# Altium schematic sheet SIO - IT8613E.schdoc
size 420 x 298 mm; Symbol: Sheet-Symbol_A3; Company: 嘉立创EDA; Version: V1.0; Page Size: A3; @Project Name: 【全网首发】X86电脑主板_copy; @Page Count: 12; @Update Date: 2025-10-09; @Create Date: 2025-10-09; @Schematic Name: SCHEMATIC1_1; @Page No: 0; @Page Name: SIO - IT8613E; Device: Sheet-Symbol_A3
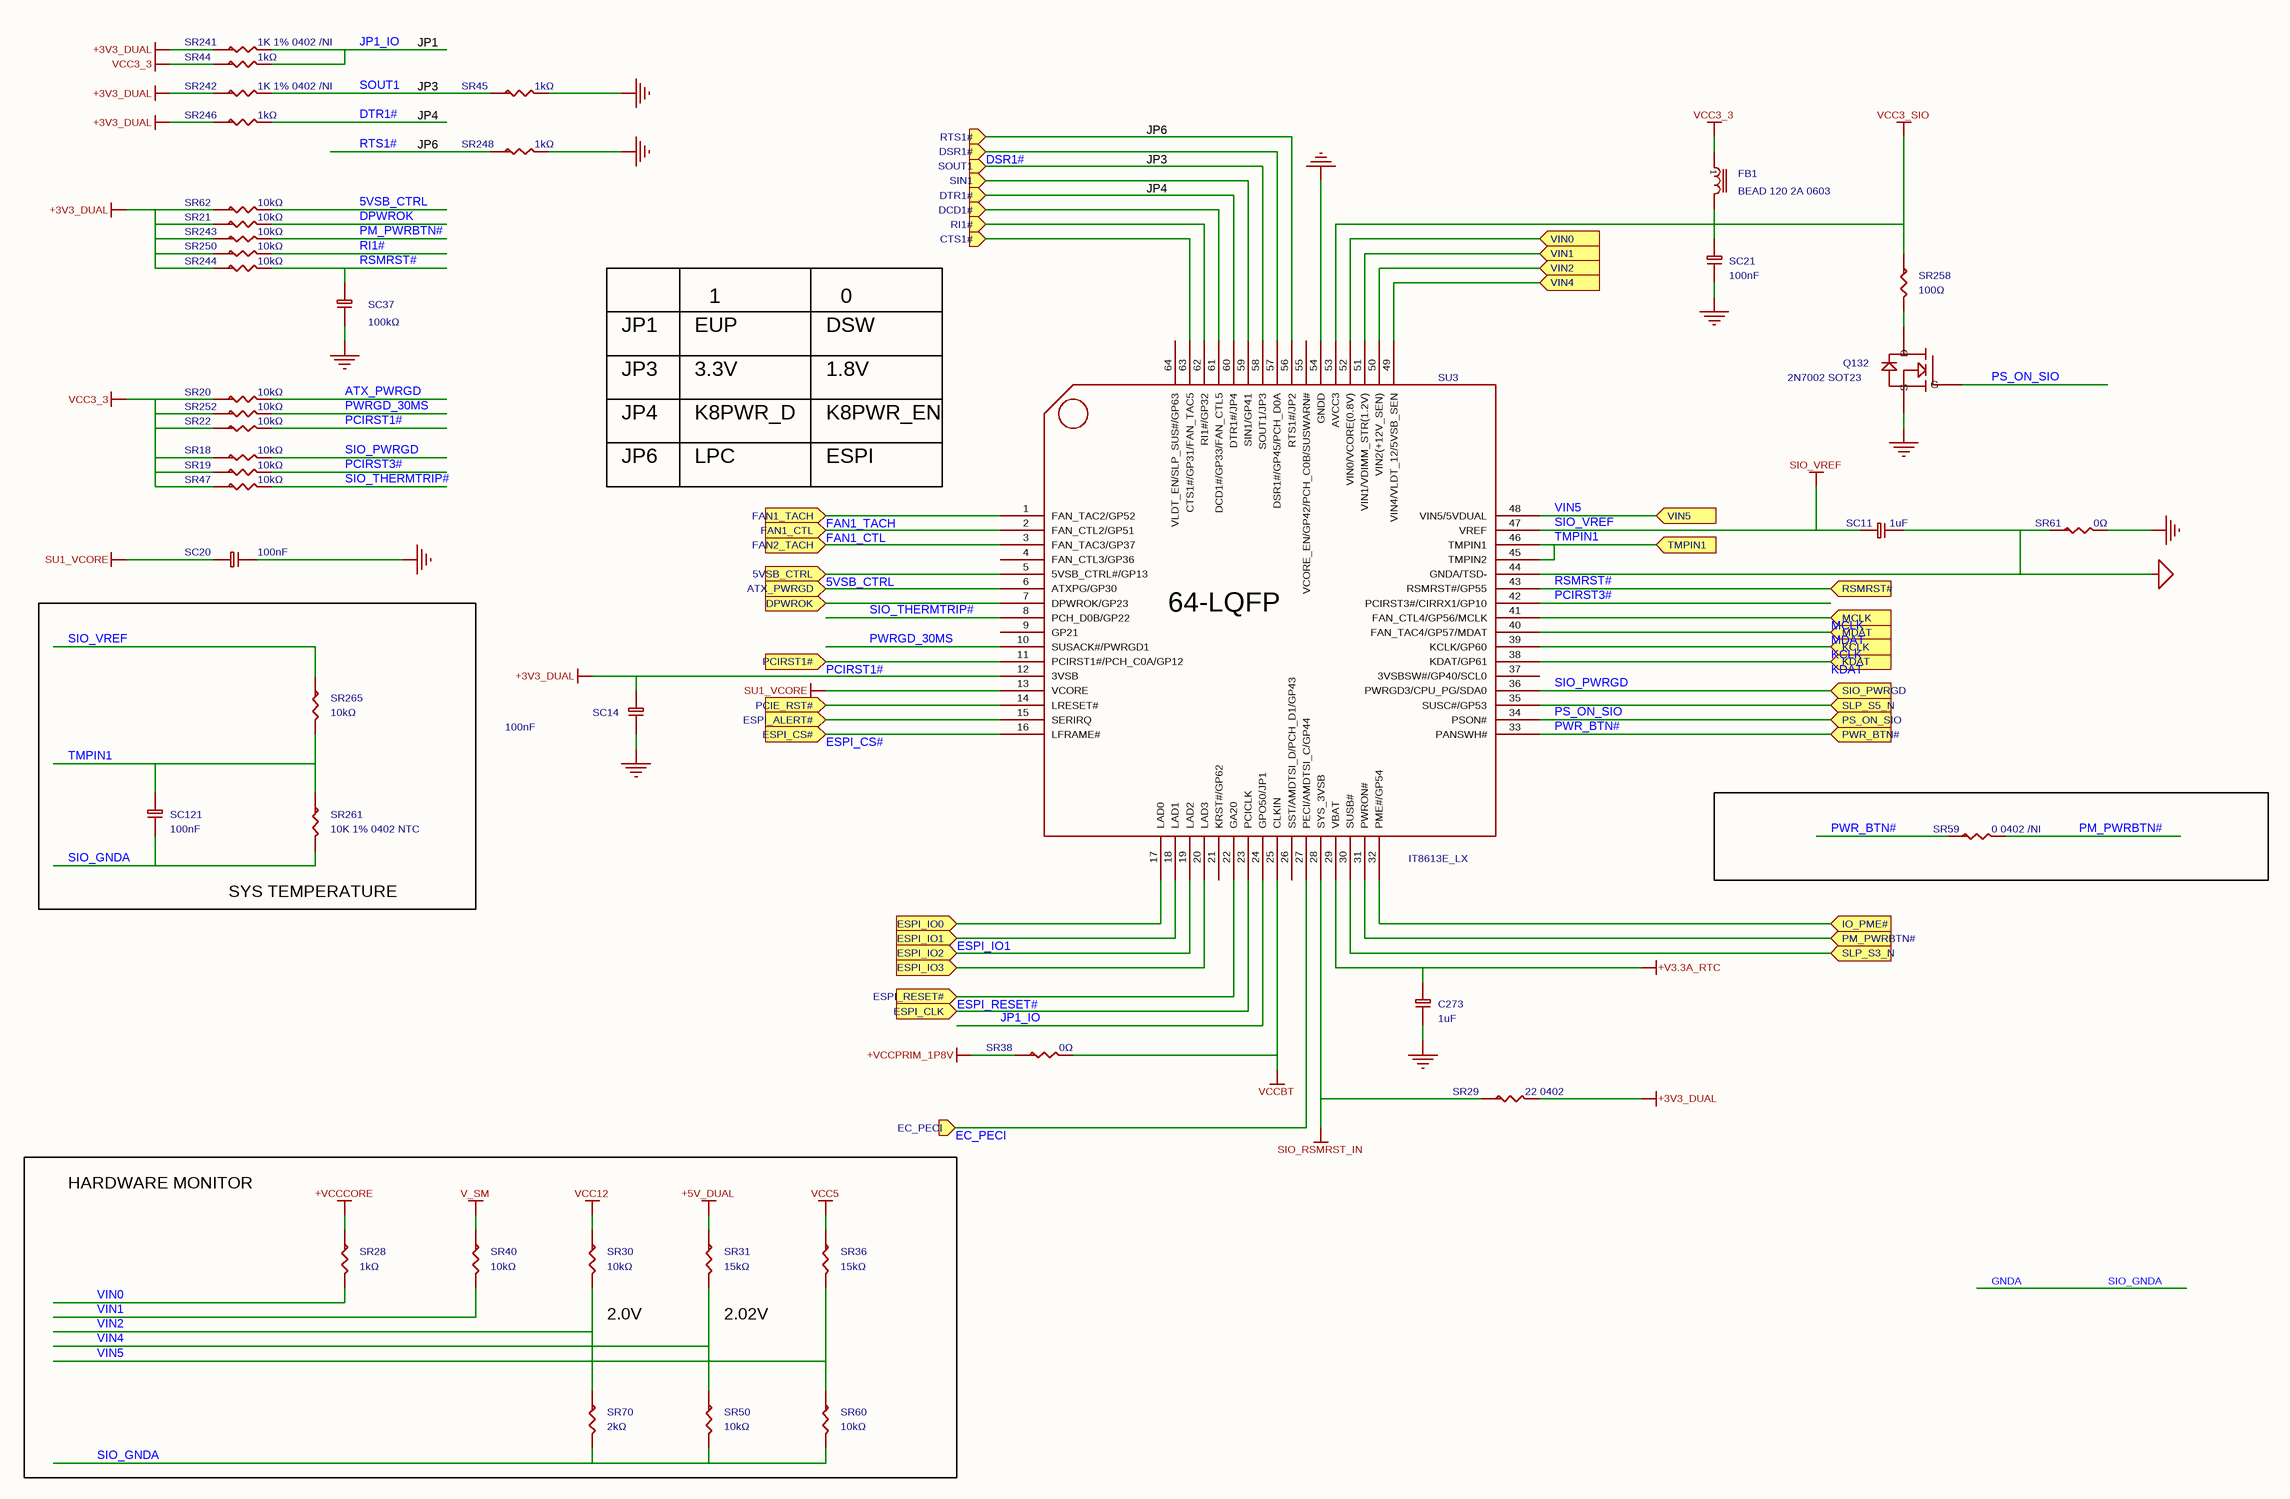
[diagram p0: SIO - IT8613E.schdoc]

## Parts
C273  1uF  [C0402]
FB1  value BEAD 120 2A 0603  [FB0603_1]  (hidden comment: FERRITE BEAD)
Q132  value 2N7002 SOT23  [SOT23_123]  (hidden comment: 2N7002)
SC11  1uF  [C0402]
SC14  100nF  [C0402_2]
SC20  100nF  [C0402_1]
SC21  100nF  [C0402]
SC37  100kΩ  [C0402]
SC121  100nF  [C0402]
SR18  10kΩ  [R0402_2]
SR19  10kΩ  [R0402_3]
SR20  10kΩ  [R0402]
SR21  10kΩ  [R0402]
SR22  10kΩ  [R0402]
SR28  1kΩ  [R0402_2]
SR29  value 22 0402  [R0402_3]  (hidden comment: R-0603)
SR30  10kΩ  [R0402_2]
SR31  15kΩ  [R0402_2]
SR36  15kΩ  [R0402_2]
SR38  0Ω  [R0402_1]
SR40  10kΩ  [R0402_2]
SR44  1kΩ  [R0402_3]
SR45  1kΩ  [R0402_2]
SR47  10kΩ  [R0402_1]
SR50  10kΩ  [R0402]
SR59  value 0 0402 /NI  [R0402]  (hidden comment: R-0603)
SR60  10kΩ  [R0402]
SR61  0Ω  [R0402]
SR62  10kΩ  [R0402]
SR70  2kΩ  [R0402_2]
SR241  value 1K 1% 0402 /NI  [R0402_3]  (hidden comment: R-0603)
SR242  value 1K 1% 0402 /NI  [R0402]  (hidden comment: R-0603)
SR243  10kΩ  [R0402_2]
SR244  10kΩ  [R0402_2]
SR246  1kΩ  [R0402_2]
SR248  1kΩ  [R0402]
SR250  10kΩ  [R0402_2]
SR252  10kΩ  [R0402_1]
SR258  100Ω  [R0402]
SR261  value 10K 1% 0402 NTC  [R0402]  (hidden comment: NCP15XH103F03RC)
SR265  10kΩ  [R0402]
SU3  value IT8613E_LX  [LQFP64_0_4]  (hidden comment: IT8712H_AP_0)

## Blocks framed on the sheet
SYS TEMPERATURE: SC121 SR261 SR265

## Ports
5VSB_CTRL (in), ATX_PWRGD (in), CTS1# (in), DCD1# (in), DPWROK (in), DSR1# (in), DTR1# (in), EC_PECI (in), ESPI_ALERT# (in), ESPI_CLK (in), ESPI_CS# (in), ESPI_IO0 (in), ESPI_IO1 (in), ESPI_IO2 (in), ESPI_IO3 (in), ESPI_RESET# (in), FAN1_CTL (in), FAN1_TACH (in), FAN2_TACH (in), IO_PME# (in), KCLK (in), KDAT (in), MCLK (in), MDAT (in), PCIE_RST# (in), PCIRST1# (in), PM_PWRBTN# (in), PS_ON_SIO (in), PWR_BTN# (in), RI1# (in), RSMRST# (in), RTS1# (in), SIN1 (in), SIO_PWRGD (in), SLP_S3_N (in), SLP_S5_N (in), SOUT1 (in), TMPIN1 (in), VIN0 (in), VIN1 (in), VIN2 (in), VIN4 (in), VIN5 (in)

## Nets
+3V3_DUAL: SC14.2 SR21.1 SR29.2 SR62.1 SR241.1 SR242.1 SR243.1 SR244.1 SR246.1 SR250.1 SU3.12(3VSB)
+5V_DUAL: SR31.1
+V3.3A_RTC: C273.2 SU3.29(VBAT)
+VCCCORE: SR28.1
+VCCPRIM_1P8V: SR38.1
GND: C273.1 Q132.2(S) SC14.1 SC20.1 SC21.1 SC37.1 SR45.2 SR61.2 SR248.2 SU3.54(GNDD)
GNDA: SC11.1 SC121.1 SR50.2 SR60.2 SR61.1 SR70.2 SR261.2 SU3.44(GNDA/TSD-)  [also labelled SIO_GNDA]
SIO_RSMRST_IN: SR29.1 SU3.28(SYS_3VSB)
SIO_VREF: SC11.2 SR265.1 SU3.47(VREF)
SU1_VCORE: SC20.2 SU3.13(VCORE)
V_SM: SR40.1
VCC3_3: FB1.1 SR18.1 SR19.1 SR20.1 SR22.1 SR44.1 SR47.1 SR252.1
VCC3_SIO: FB1.2 SC21.2 SR258.1 SU3.53(AVCC3)
VCC5: SR36.1
VCC12: SR30.1
VCCBT: SR38.2 SU3.25(CLKIN)
5VSB_CTRL: SR62.2 SU3.5(5VSB_CTRL#/GP13) ; port 5VSB_CTRL
ATX_PWRGD: SU3.6(ATXPG/GP30) ; port ATX_PWRGD
ATX_PWRGD: SR20.2  [a separate net that carries the same name]
CTS1#: SU3.63(CTS1#/GP31/FAN_TAC5) ; port CTS1#
DCD1#: SU3.61(DCD1#/GP33/FAN_CTL5) ; port DCD1#
DPWROK: SR21.2
DPWROK: SU3.7(DPWROK/GP23) ; port DPWROK  [a separate net that carries the same name]
DSR1#: SU3.57(DSR1#/GP45/PCH_D0A) ; port DSR1#
DTR1#: SR246.2
DTR1#: SU3.60(DTR1#/JP4) ; port DTR1#  [a separate net that carries the same name]
EC_PECI: SU3.27(PECI/AMDTSI_C/GP44) ; port EC_PECI
ESPI_ALERT#: SU3.15(SERIRQ) ; port ESPI_ALERT#
ESPI_CLK: SU3.23(PCICLK) ; port ESPI_CLK
ESPI_CS#: SU3.16(LFRAME#) ; port ESPI_CS#
ESPI_IO0: SU3.17(LAD0) ; port ESPI_IO0
ESPI_IO1: SU3.18(LAD1) ; port ESPI_IO1
ESPI_IO2: SU3.19(LAD2) ; port ESPI_IO2
ESPI_IO3: SU3.20(LAD3) ; port ESPI_IO3
ESPI_RESET#: SU3.22(GA20) ; port ESPI_RESET#
FAN1_CTL: SU3.2(FAN_CTL2/GP51) ; port FAN1_CTL
FAN1_TACH: SU3.1(FAN_TAC2/GP52) ; port FAN1_TACH
FAN2_TACH: SU3.3(FAN_TAC3/GP37) ; port FAN2_TACH
IO_PME#: SU3.32(PME#/GP54) ; port IO_PME#
JP1_IO: SR44.2 SR241.2 SU3.24(GPO50/JP1)
KCLK: SU3.39(KCLK/GP60) ; port KCLK
KDAT: SU3.38(KDAT/GP61) ; port KDAT
MCLK: SU3.41(FAN_CTL4/GP56/MCLK) ; port MCLK
MDAT: SU3.40(FAN_TAC4/GP57/MDAT) ; port MDAT
PCIE_RST#: SU3.14(LRESET#) ; port PCIE_RST#
PCIRST1#: SR22.2 SU3.11(PCIRST1#/PCH_C0A/GP12) ; port PCIRST1#
PCIRST3#: SR19.2 SU3.42(PCIRST3#/CIRRX1/GP10)
PM_PWRBTN#: SR59.2 SR243.2
PM_PWRBTN#: SU3.31(PWRON#) ; port PM_PWRBTN#  [a separate net that carries the same name]
PS_ON_SIO: Q132.1(G) SU3.34(PSON#) ; port PS_ON_SIO
PWR_BTN#: SR59.1 SU3.33(PANSWH#) ; port PWR_BTN#
PWRGD_30MS: SR252.2 SU3.10(SUSACK#/PWRGD1)
RI1#: SU3.62(RI1#/GP32) ; port RI1#
RI1#: SR250.2  [a separate net that carries the same name]
RSMRST#: SC37.2 SR244.2 SU3.43(RSMRST#/GP55) ; port RSMRST#
RTS1#: SU3.56(RTS1#/JP2) ; port RTS1#
RTS1#: SR248.1  [a separate net that carries the same name]
SIN1: SU3.59(SIN1/GP41) ; port SIN1
SIO_PWRGD: SR18.2 SU3.36(PWRGD3/CPU_PG/SDA0) ; port SIO_PWRGD
SIO_THERMTRIP#: SR47.2 SU3.8(PCH_D0B/GP22)
SLP_S3_N: SU3.30(SUSB#) ; port SLP_S3_N
SLP_S5_N: SU3.35(SUSC#/GP53) ; port SLP_S5_N
SOUT1: SU3.58(SOUT1/JP3) ; port SOUT1
SOUT1: SR45.1 SR242.2  [a separate net that carries the same name]
TMPIN1: SC121.2 SR261.1 SR265.2 SU3.45(TMPIN2) SU3.46(TMPIN1) ; port TMPIN1
VIN0: SU3.52(VIN0/VCORE(0.8V)) ; port VIN0
VIN0: SR28.2  [a separate net that carries the same name]
VIN1: SU3.51(VIN1/VDIMM_STR(1.2V)) ; port VIN1
VIN1: SR40.2  [a separate net that carries the same name]
VIN2: SU3.50(VIN2(+12V_SEN)) ; port VIN2
VIN2: SR30.2 SR70.1  [a separate net that carries the same name]
VIN4: SU3.49(VIN4/VLDT_12/5VSB_SEN) ; port VIN4
VIN4: SR31.2 SR50.1  [a separate net that carries the same name]
VIN5: SR36.2 SR60.1 SU3.48(VIN5/5VDUAL) ; port VIN5
NetQ132_3: Q132.3(D) SR258.2

Not connected (* = marked no-connect by the designer): SU3 4(FAN_CTL3/GP36) 9(GP21) 21(KRST#/GP62) 26(SST/AMDTSI_D/PCH_D1/GP43) 37(3VSBSW#/GP40/SCL0) 55(VCORE_EN/GP42/PCH_C0B/SUSWARN#) 64(VLDT_EN/SLP_SUS#/GP63)

## Notes on the sheet
- JP1
- JP3
- JP4
- JP6
- EUP
- 1
- DSW
- 0
- 3.3V
- K8PWR_D
- 1.8V
- K8PWR_EN
- LPC
- ESPI
- HARDWARE MONITOR
- (near SR30) 2.0V
- (near SR31) 2.02V
- 更新日期
- 2025-10-09
- 原理图
- 图页
- SCHEMATIC1_1
- SIO - IT8613E
- 创建日期
- 物料编码
- 审阅
- 绘制
- 【全网首发】X86电脑主板_copy
- 版本
- V1.0
- 尺寸
- A3
- 页
- 嘉立创EDA
- 共
- 12
- (in symbol IT8712H_AP_0) 64-LQFP

## Library data of the parts
C273 SC11 = CL05A105KQ5NNNC: 容值:1uF;精度:±10%;额定电压:6.3V;材质(温度系数):X5R;; Manufacturer: SAMSUNG(三星); Symbol: C-0603_2; AddInBom: yes; ModelId: 36a51122f27c49738f86b3bfa98863e0; ModelName: C0402_L1.0-W0.5-H0.5; ModelTransform: 39.37,19.685,0,0,0,0,0,0,0; Tolerance: ±10%; Voltage Rated: 6.3V; Temperature Coefficient: X5R; Device: CL05A105KQ5NNNC; Value: 1uF; LCSC Part Name: 1uF ±10% 6.3V; SupplierPart: C107372; ManufacturerPart: CL05A105KQ5NNNC; Supplier Footprint: 0402; JLCPCB Part Class: Extended Part; Datasheet: https://atta.szlcsc.com/upload/public/pdf/source/20160218/1457707763339.pdf; Supplier: LCSC; ConvertToPcb: yes; FootprintName: C0402
FB1 = FERRITE BEAD_2: Check: false; AddInBom: yes; Device: FERRITE BEAD_2; Symbol: FERRITE BEAD; FootprintName: FB0603_1; ConvertToPcb: yes
Q132 = 2N7002_C8545: 类型:N沟道;漏源电压(Vdss):60V;连续漏极电流(Id):115mA;功率(Pd):200mW;导通电阻(RDS(on)@Vgs,Id):7.5Ω@10V,500mA;阈值电压(Vgs(th)@Id):2.5V@250uA;; Manufacturer: CJ(江苏长电/长晶); Symbol: MOS,2N7002,SOT23,60V,300mA_0; Type: N沟道; ModelId: c62791f0466c4ae2a892c056b845b0ca; AddInBom: yes; ModelName: SOT-23-3P_L2.9-W1.3-H1.0-LS2.4-P0.95; ModelTransform: 98.425,114.173,0,180,0,0,0.0005,-0.0005,0; Power Dissipation (Pd): 200mW; Drain Source Voltage (Vdss): 60V; Continuous Drain Current (Id): 115mA; Device: 2N7002_C8545; Supplier: LCSC; Datasheet: https://atta.szlcsc.com/upload/public/pdf/source/20170302/1488422688078.pdf; FootprintName: SOT23_123; SupplierPart: C8545; ConvertToPcb: yes; LCSC Part Name: N沟道 60V 115mA; JLCPCB Part Class: Basic Part; ManufacturerPart: 2N7002; Supplier Footprint: SOT-23; Gate Threshold Voltage (Vgs(th)@Id): 2.5V@250uA; Drain Source On Resistance (RDS(on)@Vgs,Id): 7.5Ω@10V,500mA
SC14 SC20 SC21 SC121 = CL05B104KO5NNNC: 容值:100nF;精度:±10%;额定电压:16V;材质(温度系数):X7R;; Manufacturer: SAMSUNG(三星); Symbol: C-0603_2; ModelId: 36a51122f27c49738f86b3bfa98863e0; Tolerance: ±10%; AddInBom: yes; Voltage Rated: 16V; ModelName: C0402_L1.0-W0.5-H0.5; ModelTransform: 39.37,19.685,0,0,0,0,0,0,0; Temperature Coefficient: X7R; Device: CL05B104KO5NNNC; Value: 100nF; Supplier: LCSC; Datasheet: https://atta.szlcsc.com/upload/public/pdf/source/20160103/1457707674891.pdf; SupplierPart: C1525; ConvertToPcb: yes; LCSC Part Name: 100nF ±10% 16V; JLCPCB Part Class: Basic Part; ManufacturerPart: CL05B104KO5NNNC; Supplier Footprint: 0402
  SC14: FootprintName: C0402_2
  SC20: FootprintName: C0402_1
  SC21 SC121: FootprintName: C0402
SC37 = 0402WGF1003TCE: 电阻类型:厚膜电阻;阻值:100kΩ;精度:±1%;功率:62.5mW;; Manufacturer: UNI-ROYAL(厚声); Symbol: C-0603_0; ModelId: 671aefced39d4c318694bba8bd8efd39; Tolerance: ±1%; AddInBom: yes; Power(Watts): 62.5mW; ModelName: R0402_L1.0-W0.5-H0.5; ModelTransform: 39.37,19.685,0,0,0,0,0,0.0005,0; Overload Voltage (Max): 50V; Temperature Coefficient: ±100ppm/℃; Device: 0402WGF1003TCE; Value: 100kΩ; Type: 厚膜电阻; Supplier: LCSC; Datasheet: https://atta.szlcsc.com/upload/public/pdf/source/20200306/C422600_1E6D84923E4A46A82E41ADD87F860B5C.pdf; FootprintName: C0402; SupplierPart: C25741; ConvertToPcb: yes; LCSC Part Name: 100kΩ ±1% 62.5mW; JLCPCB Part Class: Basic Part; ManufacturerPart: 0402WGF1003TCE; Supplier Footprint: 0402; Operating Temperature Range: -55℃~+155℃
SR18-SR22 SR30 SR40 SR47 SR50 SR60 SR62 SR243 SR244 SR250 SR252 SR265 = 0402WGF1002TCE: 电阻类型:厚膜电阻;阻值:10kΩ;精度:±1%;功率:62.5mW;; Manufacturer: UNI-ROYAL(厚声); Symbol: R-0603; ModelId: 671aefced39d4c318694bba8bd8efd39; Tolerance: ±1%; AddInBom: yes; Power(Watts): 62.5mW; ModelName: R0402_L1.0-W0.5-H0.5; ModelTransform: 39.37,19.685,0,0,0,0,0,0.0005,0; Overload Voltage (Max): 50V; Temperature Coefficient: ±100ppm/℃; Device: 0402WGF1002TCE; Value: 10kΩ; Type: 厚膜电阻; Supplier: LCSC; Datasheet: https://atta.szlcsc.com/upload/public/pdf/source/20200306/C422600_1E6D84923E4A46A82E41ADD87F860B5C.pdf; SupplierPart: C25744; ConvertToPcb: yes; LCSC Part Name: 10kΩ ±1% 62.5mW; JLCPCB Part Class: Basic Part; ManufacturerPart: 0402WGF1002TCE; Supplier Footprint: 0402; Operating Temperature Range: -55℃~+155℃
  SR18 SR30 SR40 SR243 SR244 SR250: FootprintName: R0402_2
  SR19: FootprintName: R0402_3
  SR20-SR22 SR50 SR60 SR62 SR265: FootprintName: R0402
  SR47 SR252: FootprintName: R0402_1
SR28 SR44 SR45 SR246 SR248 = 0402WGF1001TCE: 电阻类型:厚膜电阻;阻值:1kΩ;精度:±1%;功率:62.5mW;; Manufacturer: UNI-ROYAL(厚声); Symbol: R-0603; ModelId: 671aefced39d4c318694bba8bd8efd39; Tolerance: ±1%; AddInBom: yes; Power(Watts): 62.5mW; ModelName: R0402_L1.0-W0.5-H0.5; ModelTransform: 39.37,19.685,0,0,0,0,0,0.0005,0; Overload Voltage (Max): 50V; Temperature Coefficient: ±100ppm/℃; Device: 0402WGF1001TCE; Value: 1kΩ; Type: 厚膜电阻; Supplier: LCSC; Datasheet: https://atta.szlcsc.com/upload/public/pdf/source/20200306/C422600_1E6D84923E4A46A82E41ADD87F860B5C.pdf; SupplierPart: C11702; ConvertToPcb: yes; LCSC Part Name: 1kΩ ±1% 62.5mW; JLCPCB Part Class: Basic Part; ManufacturerPart: 0402WGF1001TCE; Supplier Footprint: 0402; Operating Temperature Range: -55℃~+155℃
  SR28 SR45 SR246: FootprintName: R0402_2
  SR44: FootprintName: R0402_3
  SR248: FootprintName: R0402
SR29 = R-0603: AddInBom: yes; Device: R-0603; Symbol: R-0603; FootprintName: R0402_3; ConvertToPcb: yes
SR31 SR36 = 0402WGF1502TCE: 电阻类型:厚膜电阻;阻值:15kΩ;精度:±1%;功率:62.5mW;; Manufacturer: UNI-ROYAL(厚声); Symbol: R-0603; ModelId: 671aefced39d4c318694bba8bd8efd39; Tolerance: ±1%; AddInBom: yes; Power(Watts): 62.5mW; ModelName: R0402_L1.0-W0.5-H0.5; ModelTransform: 39.37,19.685,0,0,0,0,0,0.0005,0; Overload Voltage (Max): 50V; Temperature Coefficient: ±100ppm/℃; Device: 0402WGF1502TCE; Value: 15kΩ; Type: 厚膜电阻; Supplier: LCSC; Datasheet: https://atta.szlcsc.com/upload/public/pdf/source/20200306/C422600_1E6D84923E4A46A82E41ADD87F860B5C.pdf; FootprintName: R0402_2; SupplierPart: C25756; ConvertToPcb: yes; LCSC Part Name: 15kΩ ±1% 62.5mW; JLCPCB Part Class: Basic Part; ManufacturerPart: 0402WGF1502TCE; Supplier Footprint: 0402; Operating Temperature Range: -55℃~+155℃
SR38 SR61 = 0402WGF0000TCE: 电阻类型:厚膜电阻;阻值:0Ω;精度:±1%;功率:62.5mW;; Manufacturer: UNI-ROYAL(厚声); Symbol: R-0603; ModelId: 671aefced39d4c318694bba8bd8efd39; Tolerance: ±1%; AddInBom: yes; Power(Watts): 62.5mW; ModelName: R0402_L1.0-W0.5-H0.5; ModelTransform: 39.37,19.685,0,0,0,0,0,0.0005,0; Overload Voltage (Max): 50V; Temperature Coefficient: ±800ppm/℃; Device: 0402WGF0000TCE; Value: 0Ω; Type: 厚膜电阻; Supplier: LCSC; Datasheet: https://atta.szlcsc.com/upload/public/pdf/source/20200306/C422600_1E6D84923E4A46A82E41ADD87F860B5C.pdf; SupplierPart: C17168; ConvertToPcb: yes; LCSC Part Name: 0Ω ±1% 62.5mW; JLCPCB Part Class: Basic Part; ManufacturerPart: 0402WGF0000TCE; Supplier Footprint: 0402; Operating Temperature Range: -55℃~+155℃
  SR38: FootprintName: R0402_1
  SR61: FootprintName: R0402
SR59 SR242 = R-0603_1: Check: false; AddInBom: yes; Device: R-0603_1; Symbol: R-0603; FootprintName: R0402; ConvertToPcb: yes
SR70 = 0402WGF2001TCE: 电阻类型:厚膜电阻;阻值:2kΩ;精度:±1%;功率:62.5mW;; Manufacturer: UNI-ROYAL(厚声); Symbol: R-0603; ModelId: 671aefced39d4c318694bba8bd8efd39; Tolerance: ±1%; AddInBom: yes; Power(Watts): 62.5mW; ModelName: R0402_L1.0-W0.5-H0.5; ModelTransform: 39.37,19.685,0,0,0,0,0,0.0005,0; Overload Voltage (Max): 50V; Temperature Coefficient: ±100ppm/℃; Device: 0402WGF2001TCE; Value: 2kΩ; Type: 厚膜电阻; Supplier: LCSC; Datasheet: https://atta.szlcsc.com/upload/public/pdf/source/20200306/C422600_1E6D84923E4A46A82E41ADD87F860B5C.pdf; FootprintName: R0402_2; SupplierPart: C4109; ConvertToPcb: yes; LCSC Part Name: 2kΩ ±1% 62.5mW; JLCPCB Part Class: Basic Part; ManufacturerPart: 0402WGF2001TCE; Supplier Footprint: 0402; Operating Temperature Range: -55℃~+155℃
SR241 = R-0603: Check: false; AddInBom: yes; Device: R-0603; Symbol: R-0603; FootprintName: R0402_3; ConvertToPcb: yes
SR258 = 0402WGF1000TCE: 电阻类型:厚膜电阻;阻值:100Ω;精度:±1%;功率:62.5mW;; Manufacturer: UNI-ROYAL(厚声); Symbol: R-0603; ModelId: 671aefced39d4c318694bba8bd8efd39; Tolerance: ±1%; AddInBom: yes; Power(Watts): 62.5mW; ModelName: R0402_L1.0-W0.5-H0.5; ModelTransform: 39.37,19.685,0,0,0,0,0,0.0005,0; Overload Voltage (Max): 50V; Temperature Coefficient: ±200ppm/℃; Device: 0402WGF1000TCE; Value: 100Ω; Type: 厚膜电阻; Supplier: LCSC; Datasheet: https://atta.szlcsc.com/upload/public/pdf/source/20200306/C422600_1E6D84923E4A46A82E41ADD87F860B5C.pdf; FootprintName: R0402; SupplierPart: C25076; ConvertToPcb: yes; LCSC Part Name: 100Ω ±1% 62.5mW; JLCPCB Part Class: Basic Part; ManufacturerPart: 0402WGF1000TCE; Supplier Footprint: 0402; Operating Temperature Range: -55℃~+155℃
SR261 = NCP15XH103F03RC: 阻值(25℃):10kΩ;B值(25℃/50℃):3380K;电阻精度:±1%;功率:100mW;B值精度:±1%;最大稳态电流(25℃):310uA;; Manufacturer: muRata(村田); Symbol: R-0603; AddInBom: yes; ModelId: 671aefced39d4c318694bba8bd8efd39; ModelName: R0402_L1.0-W0.5-H0.5; ModelTransform: 39.37,19.685,0,0,0,0,0,0.0005,0; Resistance @ 25℃: 10kΩ; B Constant (25℃/50℃): 3380K; Resistance Tolerance: ±1%; B Constant (25℃/85℃): 3434K; B Constant (25℃/100℃): 3455K; Power: 100mW; Steady State Current (Max): 310uA; Device: NCP15XH103F03RC; LCSC Part Name: 10kΩ 电阻精度:±1% 3380K; SupplierPart: C77131; ManufacturerPart: NCP15XH103F03RC; Supplier Footprint: 0402; JLCPCB Part Class: Extended Part; Datasheet: https://atta.szlcsc.com/upload/public/pdf/source/20191017/C437581_F6360BF8E6A38281D0EED84DF6C92458.pdf; Supplier: LCSC; ConvertToPcb: yes; FootprintName: R0402; B Constant (25℃/75℃): -; B Constant Tolerance: ±1%; Operating Temperature: -40℃~+125℃
SU3 = IT8712H_AP_0: Check: false; AddInBom: yes; Device: IT8712H_AP_0; Symbol: IT8712H_AP_0; FootprintName: LQFP64_0_4; ConvertToPcb: yes